# EasyEDA Pro project ProPrj_Codex_key_2026-10-20_10-08-15_2026-11-04.epro, board PCB2
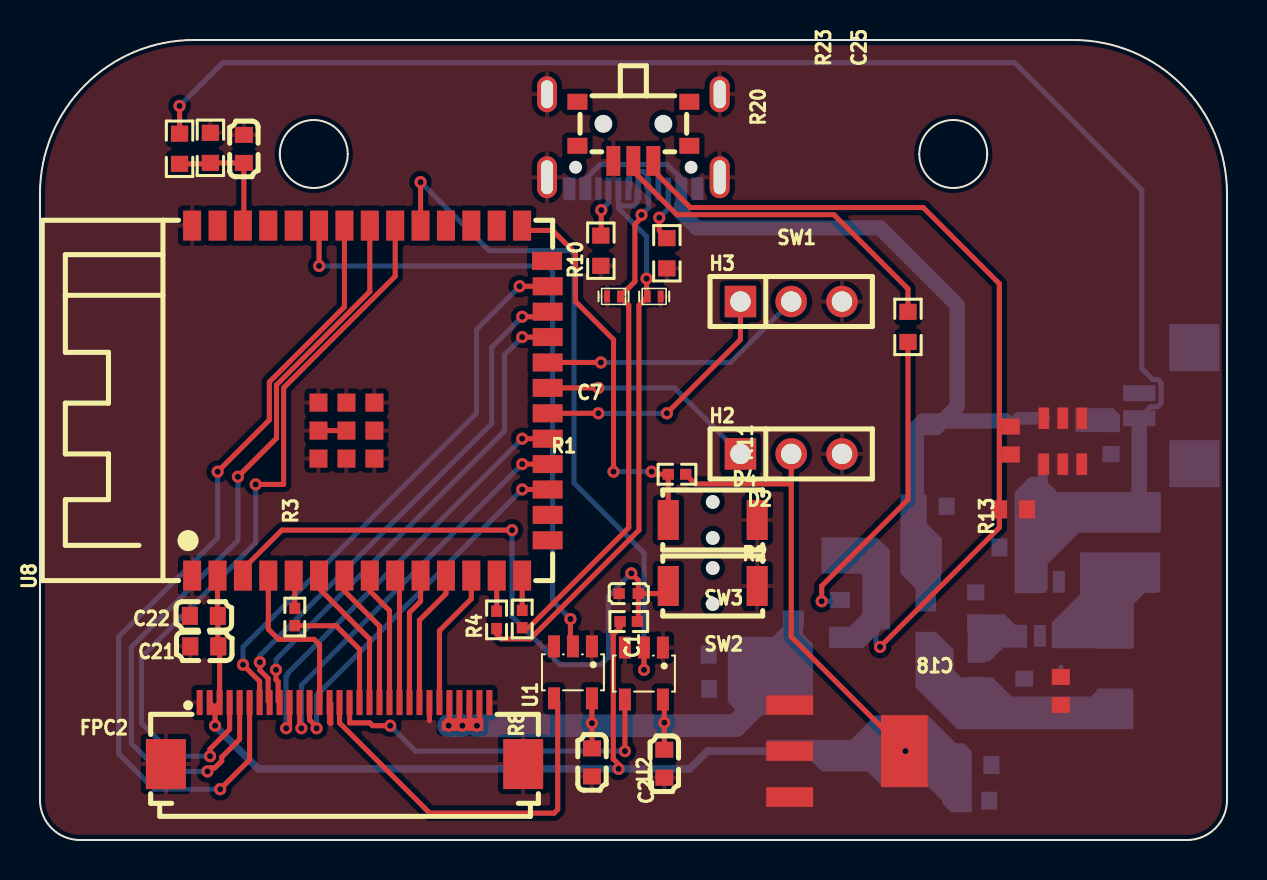
[diagram p4: board, top side]
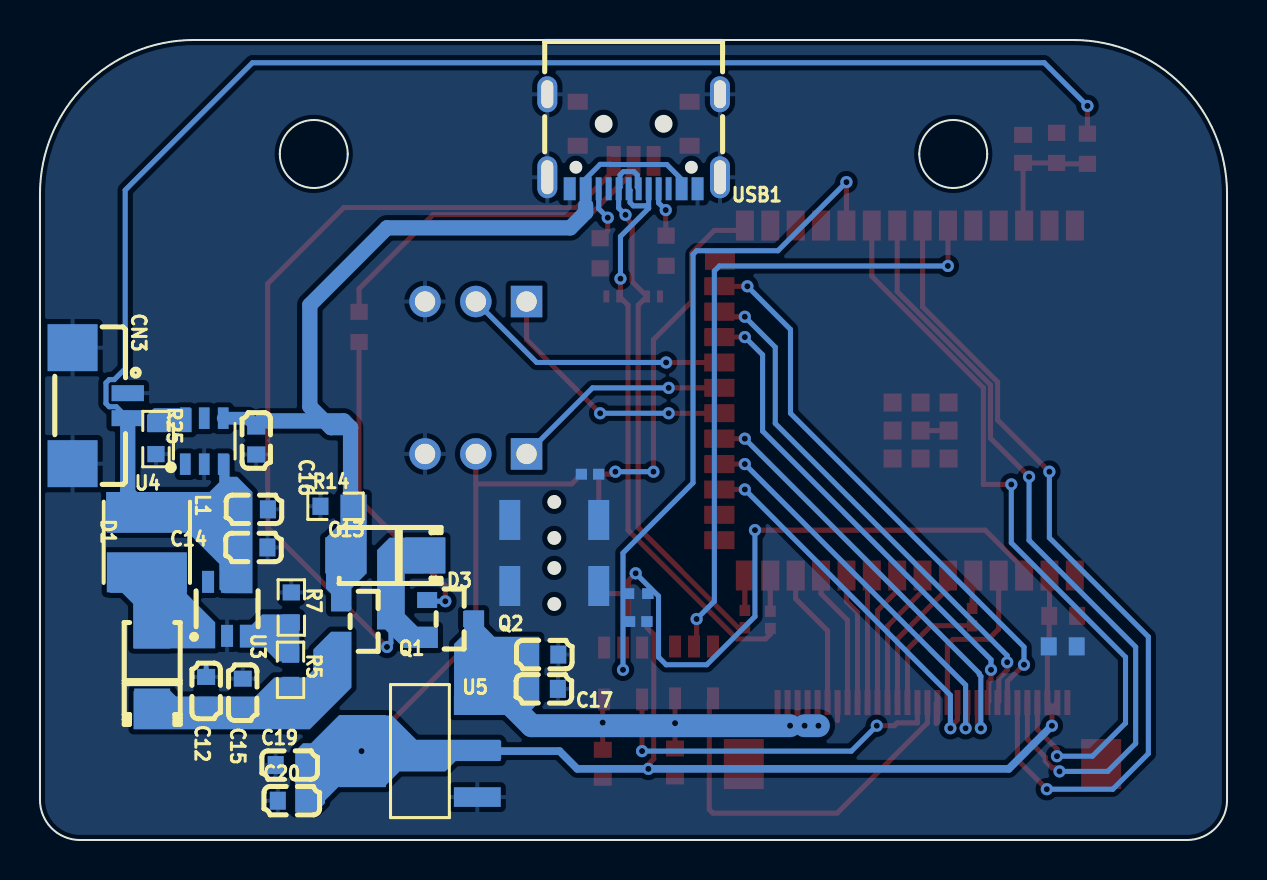
[diagram p5: board, bottom side, seen from below]

Outline 59.4 x 40 mm; copper layers: Top Layer, Bottom Layer. Coordinates in mm from the lower left corner of the outline.
Outline path: 0,32.3 arc(2.26,37.74) 7.7,40 51.7,40 arc(57.14,37.74) 59.4,32.3 59.4,2 arc(58.81,0.59) 57.4,0 2,0 arc(0.59,0.59) 0,2 0,32.3 ; 12,34.3 arc(13.7,36) 15.4,34.3 arc(13.7,32.6) 12,34.3 ; 44,34.3 arc(45.7,36) 47.4,34.3 arc(45.7,32.6) 44,34.3
Stack: Top Layer 0.035mm / Dielectric1 1.51mm FR4 er 4.5 / Bottom Layer 0.035mm

## Design rules (mm)
spacing copperThickness1oz (default): track to track 0.102, other pairs 0.152 to 0.3
spacing copperThickness2oz: track to track 0.203, other pairs 0.152 to 0.3
track width copperThickness1oz (default): min 0.127, default 0.254, max 2.54
track width copperThickness2oz: min 0.203, default 0.254, max 2.54
differential pair differentialPair (default): width min 0.127, default 0.254, max 2.54; gap min 0.152, default 0.152
net GND uses copperRegion

## Placement (name value [footprint] x y rotation side)
C1  100nF  [C0603#2]  31.24 3.81 270 top
C2  100nF  [C0603#2]  27.62 3.88 270 top
C7  1uF  [C0402]  29.46 12.32 180 top
C12  22uF  [C0603]  51.08 7.45 270 bottom
C13  22uF  [C0603]  48.69 16.53 0 bottom
C14  100nF  [C0603#2]  48.72 14.63 0 bottom
C15  100nF  [C0603#2]  49.25 7.37 270 bottom
C16  4.7uF  [C0603]  48.58 19.97 90 bottom
C17  10uF  [C0603#2]  34.19 7.56 0 bottom
C18  100nF  [C0603#2]  34.16 9.27 0 bottom
C19  100nF  [C0603#2]  46.91 3.75 180 bottom
C20  10uF  [C0603#2]  46.8 1.97 180 bottom
C21  22uF  [C0603]  8.22 9.68 0 top
C22  100nF  [C0603#2]  8.2 11.21 0 top
C25  100nF  [C0603#2]  10.2 34.55 270 top
CN3  HC-1.25-2PLT  [CONN-SMD_HC-1.25-2PLT]  56.39 21.72 270 bottom
D1  SS34  [SMA_L4.2-W2.7-LS5.0-RD]  53.79 8.57 90 bottom
D2  H5VL10B  [SOD-882_L1.0-W0.6-BI]  30.73 27.18 0 top
D3  SS34  [SMA_L4.2-W2.7-LS5.0-RD]  42.13 14.23 0 bottom
D4  H5VL10B  [SOD-882_L1.0-W0.6-BI]  28.7 27.18 180 top
FPC2  FPC-05F-30PH20  [FPC-SMD_30P-P0.50_XUNPU_FPC-05F-30PH20]  15.24 5.33 0 top
H2  FH2.54-09-03PZD  [HDR-TH_3P-P2.54-V-F]  37.59 19.3 0 top
H3  FH2.54-09-03PZD  [HDR-TH_3P-P2.54-V-F]  37.59 26.92 0 top
L1  4.7uH  [IND-SMD_L4.0-W4.0_LVS404018]  54.05 14.88 270 bottom
NOREF  -  [Pad_e218]  52.93 20.99 0 top
NOREF#2  -  [Pad_e212]  44.07 14.35 0 top
NOREF#3  -  [Pad_e293]  21.14 5.77 0 top
NOREF#4  -  [Pad_e213]  41.84 12.36 0 top
NOREF#5  -  [Pad_e208]  53.27 11.95 0 top
NOREF#6  -  [Pad_e223]  37.31 4.8 0 top
NOREF#7  -  [Pad_e209]  47.91 10.3 0 top
NOREF#8  -  [Pad_e207]  52.05 14.32 0 top
NOREF#9  -  [Pad_e206]  52.43 16.38 0 top
NOREF#10  -  [Pad_e211]  36.55 8.87 0 top
NOREF#11  -  [Pad_e224]  41.47 4.64 0 top
NOREF#12  -  [Pad_e210]  49.27 6.35 0 top
Q1  AO3401A  [SOT-23_L2.9-W1.3-P1.90-LS2.4-BR]  43.18 10.93 0 bottom
Q2  AO3401A  [SOT-23_L2.9-W1.3-P1.90-LS2.4-BR]  38.88 11.05 0 bottom
R1  10kΩ  [R0402]  29.46 10.92 0 top
R2  10kΩ  [R0402]  31.88 18.29 180 top
R3  510Ω  [R0402#2]  12.75 11.15 270 top
R4  22Ω  [R0402#2]  22.85 11.01 90 top
R5  110kΩ  [R0603]  46.86 8.51 270 bottom
R7  15kΩ  [R0603]  46.82 11.62 270 bottom
R8  22Ω  [R0402#2]  24.13 11.05 90 top
R10  5.1kΩ  [R0603]  28.07 29.46 90 top
R11  5.1kΩ  [R0603]  31.37 29.34 90 top
R13  10kΩ  [R0603]  43.43 25.65 90 top
R14  10kΩ  [R0603]  44.61 16.69 180 bottom
R20  100kΩ  [R0603]  6.98 34.56 90 top
R23  100kΩ  [R0603]  8.53 34.61 270 top
R25  2kΩ  [R0603]  53.6 20.05 90 bottom
SW1  SS-205-AGS7P-150  [SW-SMD_SS-205-AGS7P-150]  29.69 35.43 180 top
SW2  ZX-QC34-2TPDZ  [KEY-SMD_L3.9-W3.0-LS5.0-EH]  33.67 16 0 top
SW3  ZX-QC34-2TPDZ  [KEY-SMD_L3.9-W3.0-LS5.0-EH]  33.67 12.7 0 top
U1  SN74AHCT1G125DBVR  [SOT-23-5_L3.0-W1.7-P0.95-LS2.8-BR]  26.67 8.38 90 top
U2  SN74AHCT1G125DBVR  [SOT-23-5_L3.0-W1.7-P0.95-LS2.8-BR]  30.22 8.32 90 top
U3  MT3608B  [SOT-23-6_L2.9-W1.6-P0.95-LS2.8-BR]  50.04 11.56 270 bottom
U4  TP4057  [SOT-23-6_L2.9-W1.6-P0.95-LS2.8-BL]  51.18 19.94 180 bottom
U5  AMS1117-3.3  [SOT-223-3_L6.7-W3.7-P2.30-LS7.0-BR]  40.39 4.44 180 bottom
U8  ESP32-S3-WROOM-1-N16R8  [WIRELM-SMD_ESP32-S3-WROOM-1]  16.51 21.97 90 top
USB1  TYPE-C16PIN  [USB-C-SMD_TYPE-C16PIN]  29.69 34.92 0 bottom

## Footprints (pads in the part's own frame, mm; a bottom-side part is the same pattern mirrored in y, then rotated)
C0402
  rect 0.566x0.54 hole 0.001: 1(-0.481,0) 2(0.481,0)
C0603
  rect 0.8x0.9 hole 0.001: 1(-0.7,0) 2(0.7,0)
C0603#2
  rect 0.8x0.9 smd: 1(-0.7,0) 2(0.7,0)
CONN-SMD_HC-1.25-2PLT
  rect 0.8x1.62 smd: 1(-0.625,1.38) 2(0.625,1.38)
  rect 2.35x2.5 smd: 3(2.9,-1.38) 4(-2.9,-1.38)
FPC-SMD_30P-P0.50_XUNPU_FPC-05F-30PH20
  rect 0.3x1.25 smd: 1(-7.25,1.538) 2(-6.75,1.538) 3(-6.25,1.538) 4(-5.75,1.538) 5(-5.25,1.538) 6(-4.75,1.538) 7(-4.25,1.538) 8(-3.75,1.538) 9(-3.25,1.538) 10(-2.75,1.538) 11(-2.25,1.538) 12(-1.75,1.538) 13(-1.25,1.538) 14(-0.75,1.538) 15(-0.25,1.538) 16(0.25,1.538) 17(0.75,1.538) 18(1.25,1.538) 19(1.75,1.538) 20(2.25,1.538) 21(2.75,1.538) 22(3.25,1.538) 23(3.75,1.538) 24(4.25,1.538) 25(4.75,1.538) 26(5.25,1.538) 27(5.75,1.538) 28(6.25,1.538) 29(6.75,1.538) 30(7.25,1.538)
  rect 2x2.5 smd: 31(8.94,-1.538) 32(-8.94,-1.538)
HDR-TH_3P-P2.54-V-F
  rect 1.575x1.575 hole 1.02: 1(-2.54,0)
  round 1.575 hole 1.02: 2(0,0) 3(2.54,0)
IND-SMD_L4.0-W4.0_LVS404018
  rect 2x4 smd: 1(-1.5,0) 2(1.5,0)
KEY-SMD_L3.9-W3.0-LS5.0-EH
  rect 1.05x2 hole 0.001: 1(-2.225,0) 2(2.225,0)
Pad_e206
  custom 7.319x6.944 smd far side: 1(0,0)
Pad_e207
  custom 0.007x0.198 smd far side: 43(0,0)
Pad_e208
  custom 5.271x4.755 smd far side: 44(0,0)
Pad_e209
  custom 2.974x2.345 smd far side: 43(0,0)
Pad_e210
  custom 10.901x4.878 smd far side: 45(0,0)
Pad_e211
  custom 4.263x5.231 smd far side: 1(0,0)
Pad_e212
  custom 2.032x5.842 smd far side: 46(0,0)
Pad_e213
  custom 3.431x5.518 smd far side: 47(0,0)
Pad_e218
  custom 2.235x1.198 smd far side: 48(0,0)
Pad_e223
  custom 0.804x0.038 smd far side: 49(0,0)
Pad_e224
  custom 10.305x4.838 smd far side: 49(0,0)
Pad_e293
  custom 2.085x0.623 smd: 2(0,0)
R0402
  rect 0.566x0.54 hole 0.001: 1(-0.433,0) 2(0.433,0)
R0402#2
  rect 0.566x0.54 smd: 1(-0.433,0) 2(0.433,0)
R0603
  rect 0.806x0.864 smd: 1(-0.753,0) 2(0.753,0)
SMA_L4.2-W2.7-LS5.0-RD
  rect 2x1.8 smd: 1(-2,0) 2(2,0)
SOD-882_L1.0-W0.6-BI
  rect 0.3x0.6 smd: 1(-0.325,0) 2(0.325,0)
SOT-23-5_L3.0-W1.7-P0.95-LS2.8-BR
  rect 1.1x0.6 smd: 1(1.3,-0.95) 2(1.3,0) 3(1.3,0.95) 4(-1.3,0.95) 5(-1.3,-0.95)
SOT-23-6_L2.9-W1.6-P0.95-LS2.8-BL
  rect 0.532x1.072 hole 0.001: 1(-0.95,-1.149) 2(0,-1.149) 3(0.95,-1.149) 4(0.95,1.149) 5(0,1.149) 6(-0.95,1.149)
SOT-23-6_L2.9-W1.6-P0.95-LS2.8-BR
  rect 1.1x0.6 smd: 1(1.35,-0.95) 2(1.35,0) 3(1.35,0.95) 4(-1.35,0.95) 5(-1.35,0) 6(-1.35,-0.95)
SOT-23_L2.9-W1.3-P1.90-LS2.4-BR
  rect 1x0.8 smd: 1(1.15,-0.95) 2(1.15,0.95) 3(-1.15,0)
SOT-223-3_L6.7-W3.7-P2.30-LS7.0-BR
  rect 2.34x0.98 hole 0.001: 1(2.87,-2.3) 2(2.87,0) 3(2.87,2.3)
  rect 2.34x3.6 hole 0.001: 4(-2.87,0)
SW-SMD_SS-205-AGS7P-150
  rect 0.7x1.49 smd: 1(-1,1.478) 2(0,1.478) 3(1,1.478)
  rect 1x0.8 smd: 4(2.8,0.723) 5(2.8,-1.478) 6(-2.8,0.723) 7(-2.8,-1.478)
USB-C-SMD_TYPE-C16PIN
  oval 1x2.1 hole 0.6x1.7: 1(-4.32,1.788) 2(4.32,1.788)
  oval 1x1.8 hole 0.6x1.4: 3(-4.32,-2.362) 4(4.32,-2.362)
  rect 0.6x1.15 smd: A1B12(-3.2,2.362) A4B9(-2.4,2.362) B1A12(3.2,2.362) B4A9(2.4,2.362)
  rect 0.3x1.15 smd: A5(-1.25,2.362) A6(-0.25,2.362) A7(0.25,2.362) A8(1.25,2.362) B5(1.75,2.362) B6(0.75,2.362) B7(-0.75,2.362) B8(-1.75,2.362)
WIRELM-SMD_ESP32-S3-WROOM-1
  rect 1.5x0.9 smd: 1(-8.75,8.895) 2(-8.75,7.625) 3(-8.75,6.355) 4(-8.75,5.085) 5(-8.75,3.815) 6(-8.75,2.545) 7(-8.75,1.275) 8(-8.75,0.005) 9(-8.75,-1.265) 10(-8.75,-2.535) 11(-8.75,-3.805) 12(-8.75,-5.075) 13(-8.75,-6.345) 14(-8.75,-7.615) 27(8.75,-7.615) 28(8.75,-6.345) 29(8.75,-5.075) 30(8.75,-3.805) 31(8.75,-2.535) 32(8.75,-1.265) 33(8.75,0.005) 34(8.75,1.275) 35(8.75,2.545) 36(8.75,3.815) 37(8.75,5.085) 38(8.75,6.355) 39(8.75,7.625) 40(8.75,8.895)
  rect 0.9x1.5 smd: 15(-6.985,-8.895) 16(-5.715,-8.895) 17(-4.445,-8.895) 18(-3.175,-8.895) 19(-1.905,-8.895) 20(-0.635,-8.895) 21(0.635,-8.895) 22(1.905,-8.895) 23(3.175,-8.895) 24(4.445,-8.895) 25(5.715,-8.895) 26(6.985,-8.865)
  rect 0.9x0.9 smd: 41(-2.9,2.575) 41(-2.9,1.175) 41(-2.9,-0.225) 41(-1.5,2.575) 41(-1.5,1.175) 41(-1.5,-0.225) 41(-0.1,2.575) 41(-0.1,1.175) 41(-0.1,-0.225)

## Nets
As in the schematic, except:
+5V: C1.1 C2.1 C17.2 C18.2 FPC2.26 FPC2.27 FPC2.28 FPC2.29 NOREF#3.2 NOREF#10.1 Q2.3 U1.5 U2.5 U5.3
VBAT_5V: C12.2 C15.2 D1.1 NOREF#12.45 Q1.2 R5.2
VBATT: C13.2 C14.2 CN3.2 L1.1 NOREF#9.1 R20.2 U3.4 U3.5 U4.3
VCC: C19.2 C20.2 C21.2 C22.2 FPC2.2 FPC2.3 H2.2 NOREF#6.49 NOREF#11.49 R1.1 R2.1 U5.2 U5.4 U8.2
SEL_5V: D3.1 NOREF#4.47 Q1.3 Q2.2 SW1.1
USB_5V: C16.2 D3.2 NOREF#2.46 Q1.1 R14.2 U4.4 USB1.A4B9 USB1.B4A9
$2N18: NOREF.48 R25.2 U4.6
$2N51: NOREF#7.43 R5.1 R7.2 U3.3
$2N52: D1.2 L1.2 NOREF#5.44 NOREF#8.43 U3.1

Pads without a net: SW1 4 5 6 7; U3 6; U4 1 5; U8 15 16 26 28 29 30 36 37 39; USB1 A8 B8

## Via types
v1: diameter 0.61, hole 0.305, Top Layer to Bottom Layer, 47 vias

## Routing (per net, layer and track width the routed paths; a pad name or vN(x,y) marks a point on that pad's centre or on a via; arc(x,y) is an arc through that point)
+5V: length 27.8
  Top Layer w0.254: FPC2.28 21.49,6.09 v1(21.87,5.71) 21.99,5.84 FPC2.29 ; C2.1 27.62,5.84 v1(27.62,5.84) U1.5 ; 20.49,5.86 FPC2.26 20.49,7.14 ; v1(21.14,5.71) 20.99,5.86 FPC2.27 20.99,7.14 ; U2.5 31.24,6.95 v1(31.24,5.87) C1.1
  Bottom Layer w1.143: NOREF#10.1 36.55,7.47 34.8,5.71 v1(21.87,5.71) ; v1(21.14,5.71) v1(20.45,5.71)
GND: length 5.2
  Top Layer w0.254: FPC2.24 19.49,5.97 ; U8.41 U8.41 ; FPC2.14 14.49,7.14 ; FPC2.14 14.49,5.89 14.55,5.83 14.55,6.81 FPC2.14
  Bottom Layer w0.254: C12.1 51.08,8.64
VBATT: length 70.8
  Top Layer w0.254: v1(6.98,36.7) R20.2
  Bottom Layer w0.254: v1(6.98,36.7) 9.14,38.86 48.77,38.86 55.14,32.49 55.14,23.57 55.68,23.02 55.93,23.02 56.1,22.86 56.1,21.83 55.93,21.66 55.58,21.66 CN3.2
  Bottom Layer w0.762: CN3.2 55.01,17.34 L1.1
VCC: length 68.6
  Top Layer w0.254: 37.59,17.8 37.59,10.16 v1(43.31,4.44) ; 37.59,17.8 H2.2 ; 37.59,17.8 32.79,17.8 R2.1 ; 8.49,7.14 FPC2.2 8.76,6.6 ; U8.2 8.89,11.22 C22.2 8.9,9.7 C21.2 8.99,9.61 FPC2.3 8.76,6.64 8.76,6.6 ; v1(28.96,3.56) 28.96,3.79 28.69,4.05 28.69,10.28 29.03,10.63 R1.1 ; 8.76,6.6 v1(8.76,5.71)
  Bottom Layer w0.381: U5.2 33.4,4.44 32.51,3.56 v1(28.96,3.56) 10.92,3.56 v1(8.76,5.71)
BOOT: length 20
  Top Layer w0.254: v1(28.7,18.41) 28.7,25.02 26.8,26.92 26.8,29.34 25.65,30.48 24.37,30.48 U8.27 ; SW2.1 31.44,18.28 R2.2 30.73,18.29 v1(30.61,18.41)
  Bottom Layer w0.254: v1(28.7,18.41) v1(30.61,18.41)
COL1: length 22.3
  Top Layer w0.254: v1(12.32,5.59) 12.49,5.76 FPC2.10 12.49,7.14 ; U8.19 v1(24.13,20.07)
  Bottom Layer w0.254: v1(12.32,5.59) 12.32,8.19 12.39,8.27 12.39,8.33 v1(24.13,20.07)
COL2: length 20.4
  Top Layer w0.254: U8.18 v1(24.13,18.8) ; v1(13.08,5.59) 12.99,5.68 FPC2.11
  Bottom Layer w0.254: v1(24.13,18.8) 13.08,7.75 v1(13.08,5.59)
COL3: length 19.2
  Top Layer w0.254: v1(13.84,5.59) 13.84,5.65 13.49,6 FPC2.12 13.49,7.14 ; 25.41,17.53 v1(24.13,17.53)
  Bottom Layer w0.254: v1(13.84,5.59) 13.84,7.24 v1(24.13,17.53)
COL4: length 8.5
  Top Layer w0.254: FPC2.13 13.99,9.76 13.72,10.03 11.94,10.03 11.43,10.54 U8.4
EN: length 33.8
  Top Layer w0.254: C7.1 31.06,12.32 SW3.1 ; C7.1 29.95,10.97 R1.2 ; C7.1 29.95,12.98 v1(29.59,13.33) ; U8.3 10.16,13.55 12.1,15.49 v1(23.62,15.49)
  Bottom Layer w0.254: v1(29.59,13.33) 28.45,12.19 28.45,9.14 28.07,8.76 26.04,8.76 23.62,11.18 v1(23.62,15.49)
ENC_A: length 6.4
  Top Layer w0.254: U8.9 17.99,13.01 FPC2.21
ENC_B: length 6.6
  Top Layer w0.254: FPC2.22 18.49,11.38 19.05,11.93 U8.10
ENC_SW: length 6.9
  Top Layer w0.254: FPC2.23 18.99,10.99 20.32,12.31 U8.11
GPIO02: length 6.4
  Top Layer w0.254: R20.1 8.48,33.81 R23.2 C25.2 10.2,30.77 U8.38
GPIO05: length 1.7
  Top Layer w0.254: R3.1 12.75,13.16 U8.5
GPIO06: length 7.4
  Top Layer w0.254: FPC2.18 16.49,10.05 13.97,12.58 U8.6
GPIO07: length 7.1
  Top Layer w0.254: U8.7 15.23,12.45 16.99,10.7 FPC2.19
GPIO08: length 7
  Top Layer w0.254: U8.12 21.58,12.06 19.99,10.46 FPC2.25
GPIO12: length 13.1
  Top Layer w0.254: H3.1 35.05,25.02 v1(31.37,21.34) ; U8.20 v1(27.94,21.34)
  Bottom Layer w0.254: v1(27.94,21.34) v1(31.37,21.34)
GPIO13: length 11
  Top Layer w0.254: U8.21 v1(27.94,22.61)
  Bottom Layer w0.254: v1(27.94,22.61) 31.75,22.61 H2.1
GPIO14: length 13.4
  Top Layer w0.254: U8.22 v1(28.07,23.88)
  Bottom Layer w0.254: H3.2 34.54,23.88 v1(28.07,23.88)
GPIO15: length 6.8
  Top Layer w0.254: FPC2.20 17.49,11.47 16.51,12.45 U8.8
GPIO21: length 24.7
  Top Layer w0.254: v1(11.81,8.51) 11.81,8.02 11.92,7.91 11.92,6.94 FPC2.9 ; 25.41,25.15 v1(24.13,25.15)
  Bottom Layer w0.254: v1(11.81,8.51) 11.81,9.02 23.24,20.45 23.24,24.26 v1(24.13,25.15)
GPIO38: length 34.7
  Top Layer w0.254: U8.31 v1(19.05,32.89) ; 30.22,9.62 30.23,9.62 v1(30.23,8.51)
  Bottom Layer w0.254: v1(30.23,8.51) 30.23,14.35 26.72,17.85 26.72,29.28 26.54,29.46 22.47,29.46 v1(19.05,32.89)
GPIO39: length 38.4
  Top Layer w0.254: U8.32 17.77,28.19 12.19,22.61 12.19,17.78 12.19,17.78 v1(10.8,17.78) ; v1(8.51,4.19) 8.51,4.55 9.49,5.53 FPC2.4 9.49,7.14
  Bottom Layer w0.254: v1(8.51,4.19) 6.73,4.19 5.08,5.84 5.08,9.14 10.8,14.86 v1(10.8,17.78)
GPIO40: length 39.7
  Top Layer w0.254: U8.33 16.51,27.42 11.84,22.75 11.84,20.09 v1(9.91,18.16) ; 9.99,7.14 FPC2.5 9.99,5.04 9.09,4.14 9.09,3.95 8.75,3.61 8.56,3.61 v1(8.38,3.43)
  Bottom Layer w0.254: v1(8.38,3.43) 5.97,3.43 4.57,4.83 4.57,9.65 9.91,14.99 v1(9.91,18.16)
GPIO41: length 42.1
  Top Layer w0.254: v1(8.89,18.41) 11.48,21 11.48,22.9 15.23,26.66 U8.34 ; 10.49,7.14 FPC2.6 10.49,4.01 v1(9.02,2.54)
  Bottom Layer w0.254: v1(8.89,18.41) 8.89,15.11 3.94,10.16 3.94,4.32 5.72,2.54 v1(9.02,2.54)
GPIO42: length 33
  Top Layer w0.254: v1(26.54,11.05) 26.54,9.81 U1.2 ; U8.35 13.97,28.71 v1(13.97,28.7)
  Bottom Layer w0.254: v1(26.54,11.05) 25.65,11.94 25.65,28.45 25.4,28.7 v1(13.97,28.7)
GPIO47: length 26.3
  Top Layer w0.254: v1(24.13,26.16) 25.15,26.16 U8.24 ; FPC2.8 11.42,6.94 11.42,8.07 11,8.49 v1(11,8.89)
  Bottom Layer w0.254: v1(11,8.89) 11,9.22 22.61,20.83 22.61,24.64 v1(24.13,26.16)
GPIO48: length 28.3
  Top Layer w0.254: U8.25 v1(24,27.69) ; v1(10.16,8.76) 10.99,7.93 FPC2.7
  Bottom Layer w0.254: v1(10.16,8.76) 10.16,9.65 21.84,21.34 21.84,25.53 v1(24,27.69)
SEL_5V: length 43.6
  Top Layer w0.254: SW1.1 30.69,33.47 32.54,31.62 44.2,31.62 48.01,27.81 48.01,15.62 v1(42.04,9.65)
  Bottom Layer w0.254: NOREF#4.47 41.84,9.85 v1(42.04,9.65)
SK6812_KEY: length 7.4
  Top Layer w0.254: 14.99,6.87 14.99,5.86 19.5,1.34
SK6812_Key: length 12.1
  Top Layer w0.254: 19.5,1.34 25.73,1.34 25.91,1.52 25.91,6.89 U1.4
TOUCH: length 6.4
  Top Layer w0.254: 12.75,10.71 14.81,10.71 15.99,9.54 15.99,6.87
USB_5V: length 45.8
  Bottom Layer w0.254: USB1.B4A9 32.13,32.6 32.13,33.02 31.37,33.78 30.86,33.78 30.85,33.77 28.03,33.77 27.29,33.03 USB1.A4B9
  Bottom Layer w0.635: C16.2 48.99,21.09 U4.4
  Bottom Layer w0.762: 45.17,20.95 44.84,20.62 43.86,20.62 ; 45.17,20.95 45.9,21.68 45.9,26.75 42.04,30.61 32.86,30.61 32.09,31.38 32.09,31.73 ; 45.17,20.95 48.3,20.95 C16.2 ; 45.17,20.95 44.2,20.95 43.86,20.62 ; 43.86,20.62 R14.2 43.86,14.49 D3.2 44.33,14.02 Q1.1
USB_DN: length 29.4
  Top Layer w0.254: R4.1 22.85,10.3 23.09,10.05 24.53,10.05 29.97,15.49 29.97,26.74 D2.1 30.35,27.23 v1(30.35,28.07)
  Bottom Layer w0.254: 28.94,31.59 28.97,31.59 29.09,31.71 29.71,31.71 29.87,31.87 29.87,32.49 USB1.A7 ; 28.94,31.59 30.35,30.18 v1(30.35,28.07) ; 28.94,31.59 USB1.B7
USB_DN_CPU: length 1.8
  Top Layer w0.254: R4.2 22.86,11.44 U8.13
USB_DP: length 27.5
  Top Layer w0.254: R8.1 24.46,10.62 29.46,15.62 29.46,26.74 D4.1 29.77,27.92 29.77,30.78 30.1,31.12 v1(30.1,31.26)
  Bottom Layer w0.254: USB1.A6 29.51,32.63 29.51,33.25 29.68,33.42 30.21,33.42 30.37,33.25 30.37,32.63 USB1.B6 30.44,31.6 v1(30.1,31.26)
USB_DP_CPU: length 1.7
  Top Layer w0.254: R8.2 24.13,13.22 U8.14
WS2812_KEY: length 3.4
  Top Layer w0.254: 15.49,6.87 15.49,5.85 16.51,5.85 16.65,5.71 17.53,5.71 ; 15.49,6.87 15.49,6.87 ; 15.49,6.87 15.49,7.14 15.49,7.14
WS2812_Key: length 14.8
  Top Layer w0.254: U2.4 v1(29.27,4.44)
  Bottom Layer w0.254: v1(17.53,5.71) 18.8,4.44 v1(29.27,4.44)
$2N4: length 15.7
  Top Layer w0.254: R13.1 43.43,17.02 39.12,12.7 v1(39.12,11.94)
  Bottom Layer w0.254: v1(39.12,11.94) 39.97,11.94 Q2.1
$2N5: length 17.9
  Top Layer w0.254: R13.2 43.43,27.56 39.73,31.27 31.87,31.27 29.67,33.47 29.67,33.93 SW1.2
$2N37: length 2.8
  Top Layer w0.254: v1(30.99,31.11) 30.99,30.47 R11.2
  Bottom Layer w0.254: USB1.B5 31.44,31.57 v1(30.99,31.11)
$2N38: length 2.5
  Top Layer w0.254: v1(28.09,31.5) 28.09,30.24 R10.2
  Bottom Layer w0.254: USB1.A5 28.44,31.85 v1(28.09,31.5)

## Copper pours and planes (outline as drawn; the poured copper is in the pictures)
GND on Top Layer: -8,47.12 65.15,47.12 65.15,-3.56 -8,-3.56
GND on Bottom Layer: -11.68,48.13 67.82,48.13 67.82,-6.6 -11.68,-6.6
